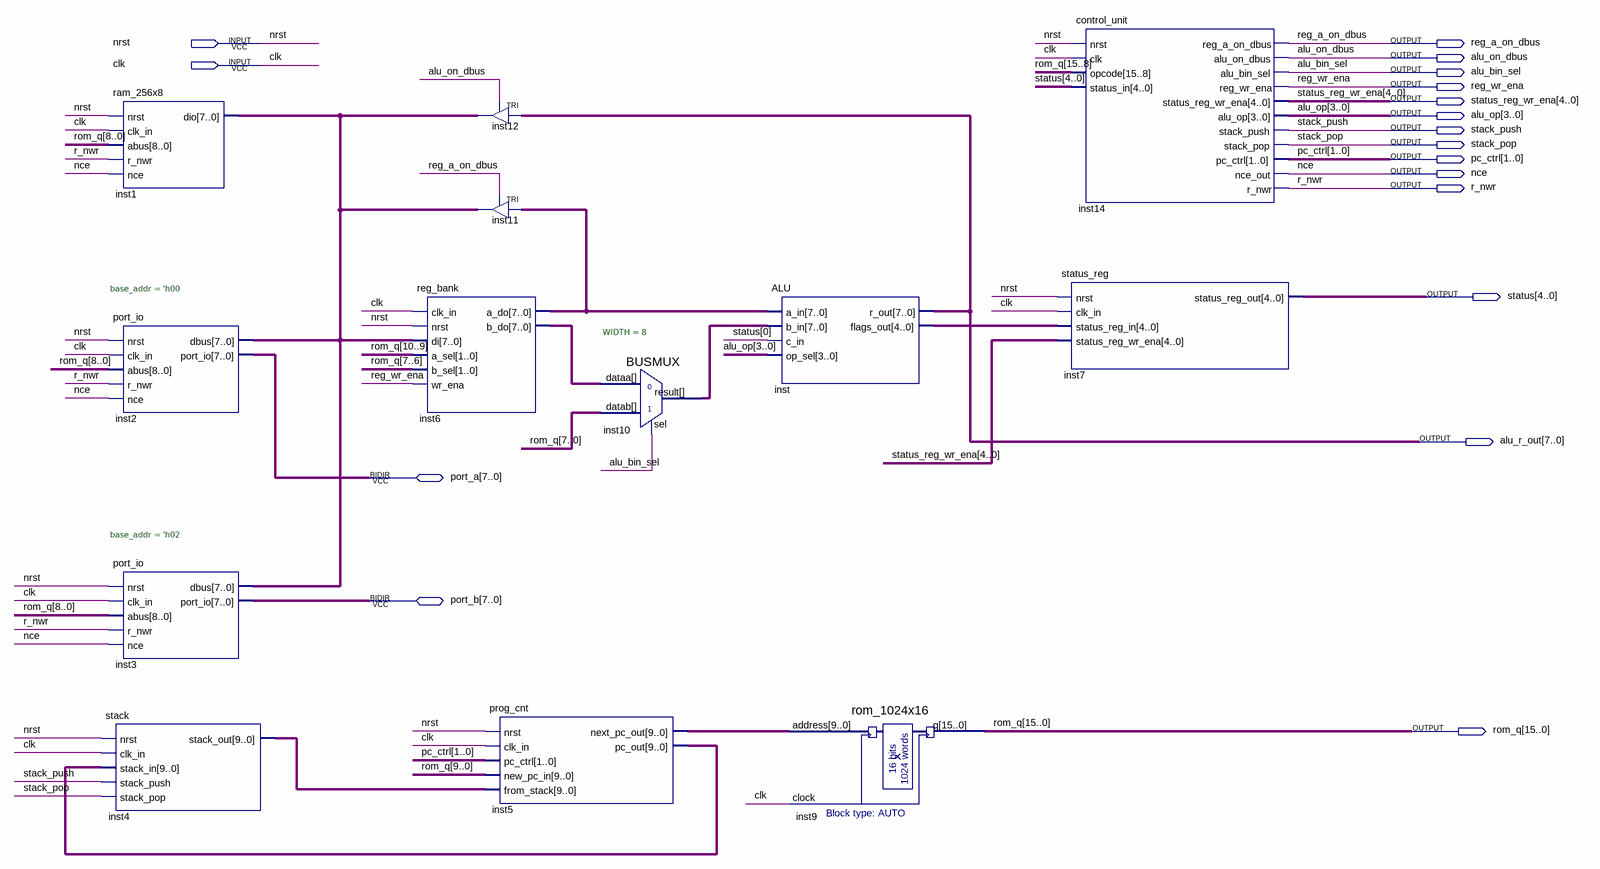
[diagram p0: schematic sheet]
// Quartus schematic Puc261_tp4_teste.bdf as structural Verilog: 13 symbols, 18 pins
module Puc261_tp4_teste (
  input  nrst,
  input  clk,
  inout  [7:0] port_a,
  inout  [7:0] port_b,
  output reg_a_on_dbus,
  output alu_on_dbus,
  output alu_bin_sel,
  output reg_wr_ena,
  output [4:0] status_reg_wr_ena,
  output [3:0] alu_op,
  output stack_push,
  output stack_pop,
  output [1:0] pc_ctrl,
  output nce,
  output r_nwr,
  output [4:0] status,
  output [7:0] alu_r_out,
  output [15:0] rom_q
);

  wire [4:0] inst_flags_out;
  wire [7:0] inst1_dio, inst6_a_do, inst6_b_do, inst10_result;
  wire [9:0] inst4_stack_out, inst5_next_pc_out, inst5_pc_out;

  ram_256x8 inst1 (.nrst(nrst), .clk_in(clk), .abus(rom_q[8:0]), .r_nwr(r_nwr), .nce(nce), .dio(inst1_dio));
  port_io #(.base_addr('h00)) inst2 (
    .nrst(nrst), .clk_in(clk), .abus(rom_q[8:0]), .r_nwr(r_nwr), .nce(nce), .dbus(inst1_dio), .port_io(port_a));
  port_io #(.base_addr('h02)) inst3 (
    .nrst(nrst), .clk_in(clk), .abus(rom_q[8:0]), .r_nwr(r_nwr), .nce(nce), .dbus(inst1_dio), .port_io(port_b));
  stack inst4 (
    .nrst(nrst), .clk_in(clk), .stack_in(inst5_pc_out), .stack_push(stack_push), .stack_pop(stack_pop),
    .stack_out(inst4_stack_out));
  reg_bank inst6 (
    .clk_in(clk), .nrst(nrst), .di(inst1_dio), .a_sel(rom_q[10:9]), .b_sel(rom_q[7:6]), .wr_ena(reg_wr_ena),
    .a_do(inst6_a_do), .b_do(inst6_b_do));
  TRI inst12[7:0] (.IN(alu_r_out), .OE(alu_on_dbus), .OUT(inst1_dio));
  TRI inst11[7:0] (.IN(inst6_a_do), .OE(reg_a_on_dbus), .OUT(inst1_dio));
  prog_cnt inst5 (
    .nrst(nrst), .clk_in(clk), .pc_ctrl(pc_ctrl), .new_pc_in(rom_q[9:0]), .from_stack(inst4_stack_out),
    .next_pc_out(inst5_next_pc_out), .pc_out(inst5_pc_out));
  BUSMUX #(.WIDTH(8)) inst10 (.datab(rom_q[7:0]), .sel(alu_bin_sel), .dataa(inst6_b_do), .result(inst10_result));
  ALU inst (
    .a_in(inst6_a_do), .b_in(inst10_result), .c_in(status[0]), .op_sel(alu_op), .r_out(alu_r_out),
    .flags_out(inst_flags_out));
  rom_1024x16 inst9 (.address(inst5_next_pc_out), .clock(clk), .q(rom_q));
  control_unit inst14 (
    .nrst(nrst), .clk(clk), .opcode(rom_q[15:8]), .status_in(status), .reg_a_on_dbus(reg_a_on_dbus),
    .alu_on_dbus(alu_on_dbus), .alu_bin_sel(alu_bin_sel), .reg_wr_ena(reg_wr_ena),
    .status_reg_wr_ena(status_reg_wr_ena), .alu_op(alu_op), .stack_push(stack_push), .stack_pop(stack_pop),
    .pc_ctrl(pc_ctrl), .nce_out(nce), .r_nwr(r_nwr));
  status_reg inst7 (
    .nrst(nrst), .clk_in(clk), .status_reg_in(inst_flags_out), .status_reg_wr_ena(status_reg_wr_ena),
    .status_reg_out(status));
endmodule
